# Altium schematic sheet stspin32g4.SchDoc (part 1 of 3)
size A3; SheetNumber: 2; SheetTotal: 4
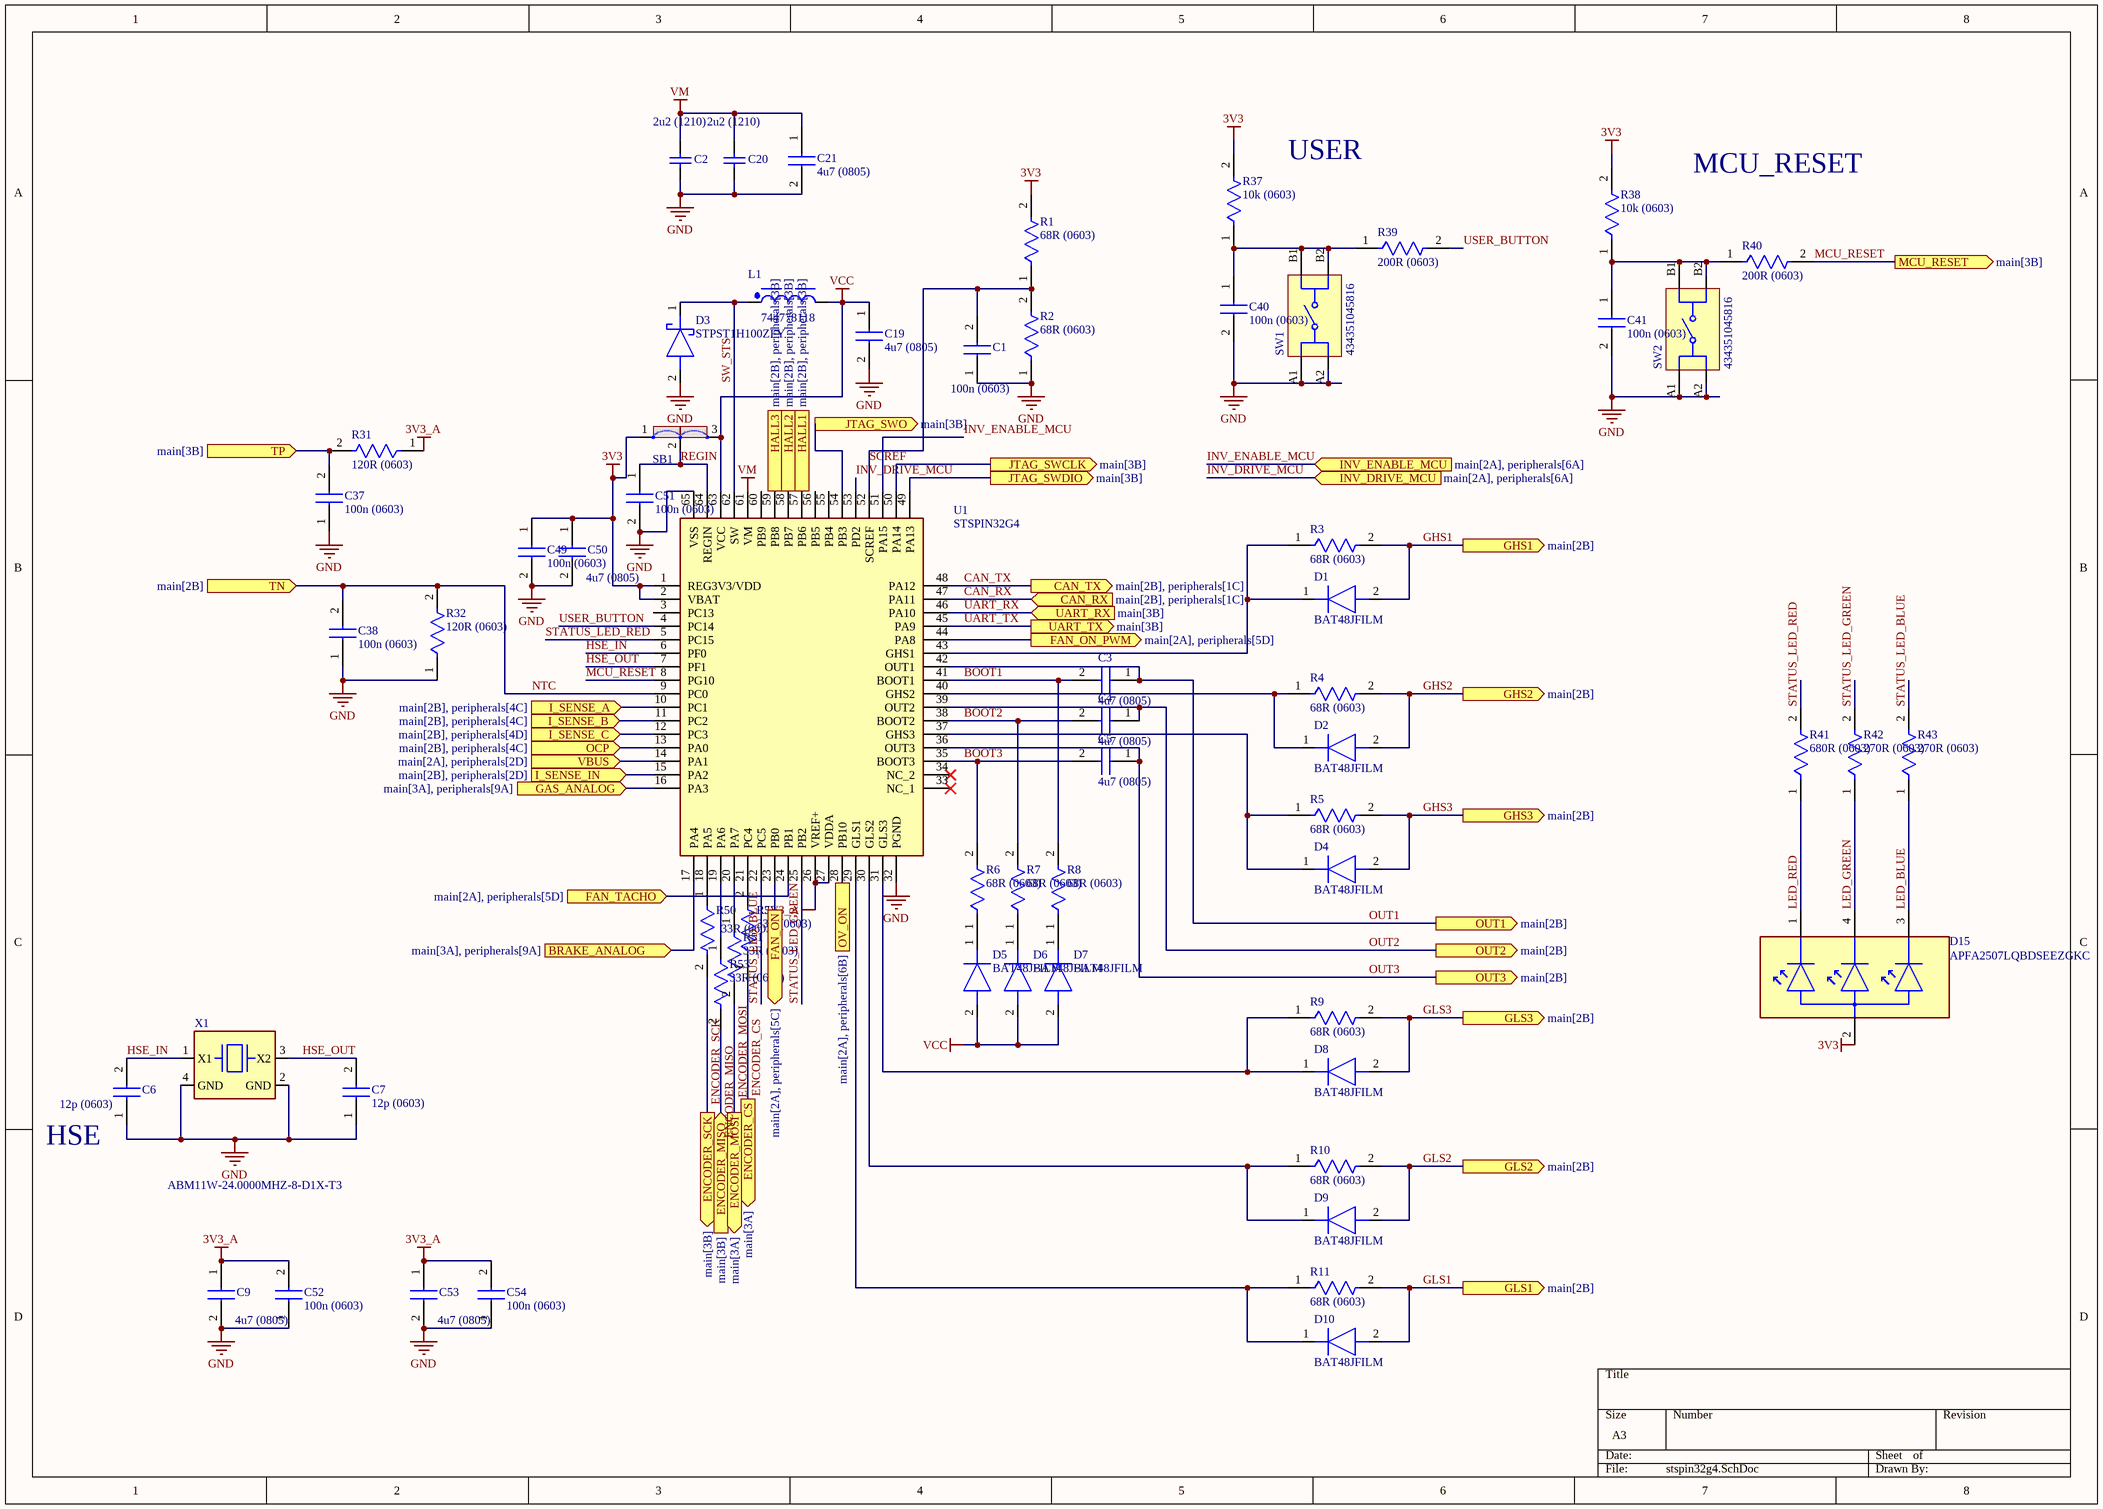
[diagram p0: stspin32g4.SchDoc]

## Parts
C1  100n (0603)  [C0603]
C2  2u2 (1210)  [WCAP-CSGP_1210_L3.2W2.5H2.5]
C3  4u7 (0805)  [C0805]
C4  4u7 (0805)  [C0805]
C5  4u7 (0805)  [C0805]
C6  12p (0603)  [C0603]
C7  12p (0603)  [C0603]
C9  4u7 (0805)  [C0805]
C19  4u7 (0805)  [C0805]
C20  2u2 (1210)  [WCAP-CSGP_1210_L3.2W2.5H2.5]
C21  4u7 (0805)  [C0805]
C37  100n (0603)  [C0603]
C38  100n (0603)  [C0603]
C40  100n (0603)  [C0603]
C41  100n (0603)  [C0603]
C49  100n (0603)  [C0603]
C50  4u7 (0805)  [C0805]
C51  100n (0603)  [C0603]
C52  100n (0603)  [C0603]
C53  4u7 (0805)  [C0805]
C54  100n (0603)  [C0603]
D1  BAT48JFILM  [SOD2513X117N]
D2  BAT48JFILM  [SOD2513X117N]
D3  STPST1H100ZFY  [SODFL3516X110N]
D4  BAT48JFILM  [SOD2513X117N]
D5  BAT48JFILM  [SOD2513X117N]
D6  BAT48JFILM  [SOD2513X117N]
D7  BAT48JFILM  [SOD2513X117N]
D8  BAT48JFILM  [SOD2513X117N]
D9  BAT48JFILM  [SOD2513X117N]
D10  BAT48JFILM  [SOD2513X117N]
D15  APFA2507LQBDSEEZGKC  [FP-APFA2507LQBDSEEZGKC-MFG]
L1  744778118  [WE-PD_7332]
R1  68R (0603)  [R0603]
R2  68R (0603)  [R0603]
R3  68R (0603)  [R0603]
R4  68R (0603)  [R0603]
R5  68R (0603)  [R0603]
R6  68R (0603)  [R0603]
R7  68R (0603)  [R0603]
R8  68R (0603)  [R0603]
R9  68R (0603)  [R0603]
R10  68R (0603)  [R0603]
R11  68R (0603)  [R0603]
R31  120R (0603)  [R0603]
R32  120R (0603)  [R0603]
R37  10k (0603)  [R0603]
R38  10k (0603)  [R0603]
R39  200R (0603)  [R0603]
R40  200R (0603)  [R0603]
R41  680R (0603)  [R0603]
R42  270R (0603)  [R0603]
R43  270R (0603)  [R0603]
R50  33R (0603)  [R0603]
R51  33R (0603)  [R0603]
R52  33R (0603)  [R0603]
R53  33R (0603)  [R0603]
SB1  triple_solder_jumper  [triple_solder_jumper]  (value not drawn)
SW1  434351045816  [434351045816]
SW2  434351045816  [434351045816]
U1  STSPIN32G4  [QFN50P900X900X100-65N-D]
X1  ABM11W-24.0000MHZ-8-D1X-T3  [XTAL_ABM11W-24.0000MHZ-8-D1X-T3]

## Ports
BRAKE_ANALOG (in, see main[3A], peripherals[9A]), CAN_RX (in, see main[2B], peripherals[1C]), CAN_TX (out, see main[2B], peripherals[1C]), ENCODER_CS (out, see main[3A]), ENCODER_MISO (in, see main[3B]), ENCODER_MOSI (out, see main[3A]), ENCODER_SCK (out, see main[3B]), FAN_ON (out, see main[2A], peripherals[5C]), FAN_ON_PWM (out, see main[2A], peripherals[5D]), FAN_TACHO (in, see main[2A], peripherals[5D]), GAS_ANALOG (in, see main[3A], peripherals[9A]), GHS1 (out, see main[2B]), GHS2 (out, see main[2B]), GHS3 (out, see main[2B]), GLS1 (out, see main[2B]), GLS2 (out, see main[2B]), GLS3 (out, see main[2B]), HALL1 (in, see main[2B], peripherals[3B]), HALL2 (in, see main[2B], peripherals[3B]), HALL3 (in, see main[2B], peripherals[3B]), I_SENSE_A (in, see main[2B], peripherals[4C]), I_SENSE_B (in, see main[2B], peripherals[4C]), I_SENSE_C (in, see main[2B], peripherals[4D]), I_SENSE_IN (in, see main[2B], peripherals[2D]), INV_DRIVE_MCU (in, see main[2A], peripherals[6A]), INV_ENABLE_MCU (in, see main[2A], peripherals[6A]), JTAG_SWCLK (out, see main[3B]), JTAG_SWDIO (out, see main[3B]), JTAG_SWO (out, see main[3B]), MCU_RESET (out, see main[3B]), OCP (in, see main[2B], peripherals[4C]), OUT1 (out, see main[2B]), OUT2 (out, see main[2B]), OUT3 (out, see main[2B]), OV_ON (out, see main[2A], peripherals[6B]), TN (in, see main[2B]), TP (in, see main[3B]), UART_RX (in, see main[3B]), UART_TX (out, see main[3B]), VBUS (in, see main[2A], peripherals[2D])

## Nets
3V3: C49.1 C50.1 D15.2(COMMON_ANODE) R1.2 R37.2 R38.2 SB1.1 U1.1(REG3V3/VDD) U1.2(VBAT)
3V3_A: C9.1 C52.2 C53.1 C54.2 R31.1 U1.26(VREF+) U1.27(VDDA)
GND: C1.1 C2.1 C6.1 C7.1 C9.2 C19.2 C20.1 C21.2 C37.1 C38.1 C40.2 C41.2 C49.2 C50.2 C51.2 C52.1 C53.2 C54.1 D3.2(A) R2.1 R32.1 SW1.A1 SW1.A2 SW2.A1 SW2.A2 U1.32(PGND) U1.65(VSS) X1.2(GND) X1.4(GND)
VCC: C19.1 D5.2(A) D6.2(A) D7.2(A) L1.2 SB1.3 U1.63(VCC)
VM: C2.2 C20.2 C21.1 U1.61(VM)
BOOT1: C3.2 R8.2 U1.41(BOOT1)
BOOT2: C4.2 R7.2 U1.38(BOOT2)
BOOT3: C5.2 R6.2 U1.35(BOOT3)
BRAKE_ANALOG: U1.17(PA4) ; port BRAKE_ANALOG
CAN_RX: U1.47(PA11) ; port CAN_RX
CAN_TX: U1.48(PA12) ; port CAN_TX
ENCODER_CS: R52.1 ; port ENCODER_CS
ENCODER_MISO: R53.2 ; port ENCODER_MISO
ENCODER_MOSI: R51.2 ; port ENCODER_MOSI
ENCODER_SCK: R50.2 ; port ENCODER_SCK
FAN_ON: U1.23(PB0) ; port FAN_ON
FAN_ON_PWM: U1.44(PA8) ; port FAN_ON_PWM
FAN_TACHO: U1.24(PB1) ; port FAN_TACHO
GAS_ANALOG: U1.16(PA3) ; port GAS_ANALOG
GHS1: D1.2(A) R3.2 ; port GHS1
GHS2: D2.2(A) R4.2 ; port GHS2
GHS3: D4.2(A) R5.2 ; port GHS3
GLS1: D10.2(A) R11.2 ; port GLS1
GLS2: D9.2(A) R10.2 ; port GLS2
GLS3: D8.2(A) R9.2 ; port GLS3
HALL1: U1.57(PB6) ; port HALL1
HALL2: U1.58(PB7) ; port HALL2
HALL3: U1.59(PB8) ; port HALL3
HSE_IN: C6.2 U1.6(PF0) X1.1(X1)
HSE_OUT: C7.2 U1.7(PF1) X1.3(X2)
I_SENSE_A: U1.10(PC1) ; port I_SENSE_A
I_SENSE_B: U1.11(PC2) ; port I_SENSE_B
I_SENSE_C: U1.12(PC3) ; port I_SENSE_C
I_SENSE_IN: U1.15(PA2) ; port I_SENSE_IN
INV_DRIVE_MCU: U1.53(PD2) ; port INV_DRIVE_MCU
INV_ENABLE_MCU: U1.51(PA15) ; port INV_ENABLE_MCU
JTAG_SWCLK: U1.50(PA14) ; port JTAG_SWCLK
JTAG_SWDIO: U1.49(PA13) ; port JTAG_SWDIO
JTAG_SWO: U1.54(PB3) ; port JTAG_SWO
LED_BLUE: D15.3(RED_C) R43.1
LED_GREEN: D15.4(GREEN_C) R42.1
LED_RED: D15.1(BLUE_C) R41.1
MCU_RESET: R40.2 U1.8(PG10) ; port MCU_RESET
NTC: C38.2 R32.2 U1.9(PC0) ; port TN
OCP: U1.13(PA0) ; port OCP
OUT1: C3.1 U1.42(OUT1) ; port OUT1
OUT2: C4.1 U1.39(OUT2) ; port OUT2
OUT3: C5.1 U1.36(OUT3) ; port OUT3
OV_ON: U1.28(PB10) ; port OV_ON
REGIN: C51.1 SB1.2 U1.64(REGIN)
SCREF: C1.2 R1.1 R2.2 U1.52(SCREF)
STATUS_LED_BLUE: R43.2 U1.22(PC5)
STATUS_LED_GREEN: R42.2 U1.25(PB2)
STATUS_LED_RED: R41.2 U1.5(PC15)
SW_STS: D3.1(K) L1.1 U1.62(SW)
TP: C37.2 R31.2 ; port TP
UART_RX: U1.46(PA10) ; port UART_RX
UART_TX: U1.45(PA9) ; port UART_TX
USER_BUTTON: R39.2 U1.4(PC14)
VBUS: U1.14(PA1) ; port VBUS
NetC40_1: C40.1 R37.1 R39.1 SW1.B1 SW1.B2
NetC41_1: C41.1 R38.1 R40.1 SW2.B1 SW2.B2
NetD1_1: D1.1(K) R3.1 U1.43(GHS1)
NetD2_1: D2.1(K) R4.1 U1.40(GHS2)
NetD4_1: D4.1(K) R5.1 U1.37(GHS3)
NetD5_1: D5.1(K) R6.1
NetD6_1: D6.1(K) R7.1
NetD7_1: D7.1(K) R8.1
NetD8_1: D8.1(K) R9.1 U1.31(GLS3)
NetD9_1: D9.1(K) R10.1 U1.30(GLS2)
NetD10_1: D10.1(K) R11.1 U1.29(GLS1)
NetR50_1: R50.1 U1.18(PA5)
NetR51_1: R51.1 U1.20(PA7)
NetR52_2: R52.2 U1.21(PC4)
NetR53_1: R53.1 U1.19(PA6)

Not connected (* = marked no-connect by the designer): U1 3(PC13) 33(NC_1)* 34(NC_2)* 55(PB4) 56(PB5) 60(PB9)

## Notes on the sheet
- USER
- MCU_RESET
- (near C6) HSE
## Library data of the parts
C1 C37 C38 C40 C41 C49 C51 = GCM188R71E104JA57D: CAP CER 0.1UF 25V X7R 0603 / 0.1 μF ±5% 25V Ceramic Capacitor X7R 0603 (1608 Metric); Manufacturer_Name: Murata Electronics; Manufacturer: Murata; Manufacturer Lifecycle Status: NRND; Value: 100nF; Datasheet Link: https://search.murata.co.jp/Ceramy/image/img/A01X/G101/ENG/GCM188R71E104JA57-01A.pdf; Height: 0.9mm; Manufacturer_Part_Number: GCM188R71E104JA57D; Mouser Part Number: 81-GCM188R71E104JAD; Mouser Price/Stock: https://www.mouser.co.uk/ProductDetail/Murata-Electronics/GCM188R71E104JA57D?qs=ui%252B2d9lVEI5lLkZDVYlCng%3D%3D; Arrow Part Number: GCM188R71E104JA57D; Arrow Price/Stock: https://www.arrow.com/en/products/gcm188r71e104ja57d/murata-manufacturing; Supplier: DigiKey; Supplier Part Number: 490-GCM188R71E104JA57DCT-ND; Manufacturer Part Number: GCM188R71E104JA57D; RoHS: Compliant; Category: Ceramic Capacitors; Stock: 2875; Pricing: 1=0,33, 10=0,196, 50=0,1434, 100=0,1272, 500=0,09986, 1000=0,09143 (USD); Case/Package: 0603; Country of Origin: Philippines; Dielectric Material: Ceramic; Export Control Classification Number (ECCN) Code: EAR99; Harmonized Tariff Schedule (HTS) Code: 8532.24.00.20; Introduction Date: 2013-11-20; Length: 1.6mm; Lifecycle Status: NRND; Max Operating Temperature: 125°C; Min Operating Temperature: -55°C; Mounting Technology: Surface Mount; Number of Terminals: 2; Ratings: AEC-Q200; REACH SVHC: Yes; Schedule B: 8532240020, 8532240020|8532240020|8532240020|8532240020|8532240020; Thickness: 800µm; Voltage Rating (DC): 25V; Width: 800µm; ComponentLink1URL: https://datasheet.octopart.com:443/GCM188R71E104JA57D-Murata-datasheet-141267551.pdf?src-supplier=Geoflip; ComponentLink1Description: https://datasheet.octopart.com:443/GCM188R71E104JA57D-Murata-datasheet-141267551.pdf?src-supplier=Geoflip; ComponentLink2URL: https://datasheet.octopart.com:443/GCM188R71E104JA57D-Murata-datasheet-140658663.pdf?src-supplier=Ciiva; ComponentLink2Description: https://datasheet.octopart.com:443/GCM188R71E104JA57D-Murata-datasheet-140658663.pdf?src-supplier=Ciiva; ComponentLink3URL: https://datasheet.octopart.com:443/GCM188R71E104JA57D-Murata-datasheet-138718229.pdf?src-supplier=Ciiva; ComponentLink3Description: https://datasheet.octopart.com:443/GCM188R71E104JA57D-Murata-datasheet-138718229.pdf?src-supplier=Ciiva; ComponentLink4URL: http://sigma.octopart.com:80/reach_statement/Murata-company-16.pdf?src-supplier=Compliance+Statements; ComponentLink4Description: http://sigma.octopart.com:80/reach_statement/Murata-company-16.pdf?src-supplier=Compliance+Statements
C2 C20 = CMP-03913-104794504-2: Cap, 2.2Uf, 100V, Mlcc, 1210 Rohs Compliant: Yes 885012209071; Insulation Resistance: 50MΩ; Length: 3.2mm; Min Operating Temperature: -55°C; Voltage Rating: 100V; Width: 2.5mm; Max Operating Temperature: 125°C; Height: 2.5mm; RoHS: Compliant; Parameter 1: *
C3-C5 C9 C19 C21 C50 C53 = GRM21BZ71E475KE15L: 25V 4.7uF X7R ±10% 0805 Multilayer Ceramic Capacitors MLCC - SMD/SMT ROHS; Manufacturer_Name: Murata Electronics; Manufacturer: Murata; Manufacturer Lifecycle Status: IN PRODUCTION; Value: 4.7µF; Datasheet Link: https://search.murata.co.jp/Ceramy/image/img/A01X/G101/ENG/GRM21BZ71E475KE15-01A.pdf; Height: 1.45mm; Manufacturer_Part_Number: GRM21BZ71E475KE15L; Mouser Part Number: 81-GRM21BZ71E475KE5L; Mouser Price/Stock: https://www.mouser.co.uk/ProductDetail/Murata-Electronics/GRM21BZ71E475KE15L?qs=Ey7%2FXF42M3feXnDNgc%252BFlQ%3D%3D; Arrow Part Number: GRM21BZ71E475KE15L; Arrow Price/Stock: https://www.arrow.com/en/products/grm21bz71e475ke15l/murata-manufacturing?utm_currency=USD&region=nac; Supplier: RS; Supplier Part Number: 2478136; Manufacturer Part Number: GRM21BZ71E475KE15L; RoHS: Compliant; Category: Ceramic Capacitors; Stock: 4700; Case/Package: 0805; Dielectric Material: Ceramic; Export Control Classification Number (ECCN) Code: EAR99; Harmonized Tariff Schedule (HTS) Code: 8532.24.00.20; Introduction Date: 2017-02-22; Length: 2mm; Lifecycle Status: Production; Material: Ceramic; Max Operating Temperature: 125°C; Min Operating Temperature: -55°C; Mounting Technology: Surface Mount; Number of Terminals: 2; REACH SVHC: Yes; Thickness: 1.25mm; Tolerance: 10%; Voltage Rating: 25V; Voltage Rating (DC): 25V; Width: 1.25mm; ComponentLink1URL: https://datasheet.octopart.com:443/GRM21BZ71E475KE15L-Murata-datasheet-155345087.pdf?src-supplier=Newark; ComponentLink1Description: https://datasheet.octopart.com:443/GRM21BZ71E475KE15L-Murata-datasheet-155345087.pdf?src-supplier=Newark; ComponentLink2URL: https://datasheet.octopart.com:443/GRM21BZ71E475KE15L-Murata-datasheet-141278877.pdf?src-supplier=Geoflip; ComponentLink2Description: https://datasheet.octopart.com:443/GRM21BZ71E475KE15L-Murata-datasheet-141278877.pdf?src-supplier=Geoflip; ComponentLink3URL: https://datasheet.octopart.com:443/GRM21BZ71E475KE15L-Murata-datasheet-165579666.pdf?src-supplier=TME; ComponentLink3Description: https://datasheet.octopart.com:443/GRM21BZ71E475KE15L-Murata-datasheet-165579666.pdf?src-supplier=TME; ComponentLink4URL: https://datasheet.octopart.com:443/GRM21BZ71E475KE15L-Murata-datasheet-140707839.pdf?src-supplier=Ciiva; ComponentLink4Description: https://datasheet.octopart.com:443/GRM21BZ71E475KE15L-Murata-datasheet-140707839.pdf?src-supplier=Ciiva; ComponentLink5URL: https://datasheet.octopart.com:443/GRM21BZ71E475KE15L-Murata-datasheet-138745135.pdf?src-supplier=Ciiva; ComponentLink5Description: https://datasheet.octopart.com:443/GRM21BZ71E475KE15L-Murata-datasheet-138745135.pdf?src-supplier=Ciiva; ComponentLink6URL: http://sigma.octopart.com:80/reach_statement/Murata-company-16.pdf?src-supplier=Compliance+Statements; ComponentLink6Description: http://sigma.octopart.com:80/reach_statement/Murata-company-16.pdf?src-supplier=Compliance+Statements
C6 C7 = CC0603FRNPO8BN120: Ceramic Capacitor, YES, Ceramic, 25V, 1% +Tol, 1% -Tol, C0G, 30ppm/Cel TC, 0.000012uF, Surface Mount, 0603; Manufacturer_Name: Murata Electronics; Manufacturer_Part_Number: GCM188R71E104JA57D; Manufacturer: Murata; Manufacturer Lifecycle Status: NRND; Value: 100nF; Datasheet Link: https://search.murata.co.jp/Ceramy/image/img/A01X/G101/ENG/GCM188R71E104JA57-01A.pdf; Height: 0.9mm; Mouser Part Number: 81-GCM188R71E104JAD; Mouser Price/Stock: https://www.mouser.co.uk/ProductDetail/Murata-Electronics/GCM188R71E104JA57D?qs=ui%252B2d9lVEI5lLkZDVYlCng%3D%3D; Arrow Part Number: GCM188R71E104JA57D; Arrow Price/Stock: https://www.arrow.com/en/products/gcm188r71e104ja57d/murata-manufacturing; Supplier: DigiKey; Supplier Part Number: 490-GCM188R71E104JA57DCT-ND; Manufacturer Part Number: GCM188R71E104JA57D; RoHS: Compliant; Category: Ceramic Capacitors; Stock: 2875; Pricing: 1=0,33, 10=0,196, 50=0,1434, 100=0,1272, 500=0,09986, 1000=0,09143 (USD); Case/Package: 0603; Country of Origin: Philippines; Dielectric Material: Ceramic; Export Control Classification Number (ECCN) Code: EAR99; Harmonized Tariff Schedule (HTS) Code: 8532.24.00.20; Introduction Date: 2013-11-20; Length: 1.6mm; Lifecycle Status: NRND; Max Operating Temperature: 125°C; Min Operating Temperature: -55°C; Mounting Technology: Surface Mount; Number of Terminals: 2; Ratings: AEC-Q200; REACH SVHC: Yes; Schedule B: 8532240020, 8532240020|8532240020|8532240020|8532240020|8532240020; Thickness: 800µm; Voltage Rating (DC): 25V; Width: 800µm; ComponentLink1URL: https://datasheet.octopart.com:443/GCM188R71E104JA57D-Murata-datasheet-141267551.pdf?src-supplier=Geoflip; ComponentLink1Description: https://datasheet.octopart.com:443/GCM188R71E104JA57D-Murata-datasheet-141267551.pdf?src-supplier=Geoflip; ComponentLink2URL: https://datasheet.octopart.com:443/GCM188R71E104JA57D-Murata-datasheet-140658663.pdf?src-supplier=Ciiva; ComponentLink2Description: https://datasheet.octopart.com:443/GCM188R71E104JA57D-Murata-datasheet-140658663.pdf?src-supplier=Ciiva; ComponentLink3URL: https://datasheet.octopart.com:443/GCM188R71E104JA57D-Murata-datasheet-138718229.pdf?src-supplier=Ciiva; ComponentLink3Description: https://datasheet.octopart.com:443/GCM188R71E104JA57D-Murata-datasheet-138718229.pdf?src-supplier=Ciiva; ComponentLink4URL: http://sigma.octopart.com:80/reach_statement/Murata-company-16.pdf?src-supplier=Compliance+Statements; ComponentLink4Description: http://sigma.octopart.com:80/reach_statement/Murata-company-16.pdf?src-supplier=Compliance+Statements; China RoHS: Compliant; Dielectric: C0G; Tolerance: 1%; ComponentLink5URL: https://datasheet.octopart.com:443/CC0603FRNPO8BN120-Yageo-datasheet-182140217.pdf?src-supplier=IHS; ComponentLink5Description: https://datasheet.octopart.com:443/CC0603FRNPO8BN120-Yageo-datasheet-182140217.pdf?src-supplier=IHS; ComponentLink6URL: http://sigma.octopart.com:80/conflict_mineral_statement/Yageo-company-3.pdf?src-supplier=Compliance+Statements; ComponentLink6Description: http://sigma.octopart.com:80/conflict_mineral_statement/Yageo-company-3.pdf?src-supplier=Compliance+Statements; ComponentLink7URL: http://sigma.octopart.com:80/rohs_statement/Yageo-company-2.pdf?src-supplier=Compliance+Statements; ComponentLink7Description: http://sigma.octopart.com:80/rohs_statement/Yageo-company-2.pdf?src-supplier=Compliance+Statements
C52 C54 = GCM188R71E105KA64D: 25V 1uF X7R ±10% 0603 Multilayer Ceramic Capacitors MLCC - SMD/SMT ROHS; Manufacturer_Name: Murata Electronics; Manufacturer_Part_Number: GCM188R71E104JA57D; Manufacturer: Murata; Manufacturer Lifecycle Status: NRND; Value: 100nF; Datasheet Link: https://search.murata.co.jp/Ceramy/image/img/A01X/G101/ENG/GCM188R71E104JA57-01A.pdf; Height: 0.9mm; Mouser Part Number: 81-GCM188R71E104JAD; Mouser Price/Stock: https://www.mouser.co.uk/ProductDetail/Murata-Electronics/GCM188R71E104JA57D?qs=ui%252B2d9lVEI5lLkZDVYlCng%3D%3D; Arrow Part Number: GCM188R71E104JA57D; Arrow Price/Stock: https://www.arrow.com/en/products/gcm188r71e104ja57d/murata-manufacturing; Supplier: DigiKey; Supplier Part Number: 490-GCM188R71E104JA57DCT-ND; Manufacturer Part Number: GCM188R71E104JA57D; RoHS: Compliant; Category: Ceramic Capacitors; Stock: 2875; Pricing: 1=0,33, 10=0,196, 50=0,1434, 100=0,1272, 500=0,09986, 1000=0,09143 (USD); Case/Package: 0603; Country of Origin: Philippines; Dielectric Material: Ceramic; Export Control Classification Number (ECCN) Code: EAR99; Harmonized Tariff Schedule (HTS) Code: 8532.24.00.20; Introduction Date: 2013-11-20; Length: 1.6mm; Lifecycle Status: NRND; Max Operating Temperature: 125°C; Min Operating Temperature: -55°C; Mounting Technology: Surface Mount; Number of Terminals: 2; Ratings: AEC-Q200; REACH SVHC: Yes; Schedule B: 8532240020, 8532240020|8532240020|8532240020|8532240020|8532240020; Thickness: 800µm; Voltage Rating (DC): 25V; Width: 800µm; ComponentLink1URL: https://datasheet.octopart.com:443/GCM188R71E104JA57D-Murata-datasheet-141267551.pdf?src-supplier=Geoflip; ComponentLink1Description: https://datasheet.octopart.com:443/GCM188R71E104JA57D-Murata-datasheet-141267551.pdf?src-supplier=Geoflip; ComponentLink2URL: https://datasheet.octopart.com:443/GCM188R71E104JA57D-Murata-datasheet-140658663.pdf?src-supplier=Ciiva; ComponentLink2Description: https://datasheet.octopart.com:443/GCM188R71E104JA57D-Murata-datasheet-140658663.pdf?src-supplier=Ciiva; ComponentLink3URL: https://datasheet.octopart.com:443/GCM188R71E104JA57D-Murata-datasheet-138718229.pdf?src-supplier=Ciiva; ComponentLink3Description: https://datasheet.octopart.com:443/GCM188R71E104JA57D-Murata-datasheet-138718229.pdf?src-supplier=Ciiva; ComponentLink4URL: http://sigma.octopart.com:80/reach_statement/Murata-company-16.pdf?src-supplier=Compliance+Statements; ComponentLink4Description: http://sigma.octopart.com:80/reach_statement/Murata-company-16.pdf?src-supplier=Compliance+Statements; Case Code (Imperial): 0603; Case Code (Metric): 1608; Depth: 800µm; Dielectric: X7R; Lead Free: Lead Free; Material: Ceramic; Packaging: Cut Tape; Radiation Hardening: No; Termination: SMD/SMT; Tolerance: 10%; Voltage: 25V; Voltage Rating: 25V; Weight: 6.293594mg; ComponentLink5URL: https://datasheet.octopart.com:443/GCM188R71E105KA64D-Murata-datasheet-39128443.pdf?src-supplier=Newark; ComponentLink5Description: https://datasheet.octopart.com:443/GCM188R71E105KA64D-Murata-datasheet-39128443.pdf?src-supplier=Newark; ComponentLink6URL: https://datasheet.octopart.com:443/GCM188R71E105KA64D-Murata-datasheet-62316951.pdf?src-supplier=element14+APAC; ComponentLink6Description: https://datasheet.octopart.com:443/GCM188R71E105KA64D-Murata-datasheet-62316951.pdf?src-supplier=element14+APAC; ComponentLink7URL: https://datasheet.octopart.com:443/GCM188R71E105KA64D-Murata-datasheet-141267554.pdf?src-supplier=Geoflip; ComponentLink7Description: https://datasheet.octopart.com:443/GCM188R71E105KA64D-Murata-datasheet-141267554.pdf?src-supplier=Geoflip; ComponentLink8URL: https://datasheet.octopart.com:443/GCM188R71E105KA64D-Murata-datasheet-140658666.pdf?src-supplier=Ciiva; ComponentLink8Description: https://datasheet.octopart.com:443/GCM188R71E105KA64D-Murata-datasheet-140658666.pdf?src-supplier=Ciiva; ComponentLink9URL: https://datasheet.octopart.com:443/GCM188R71E105KA64D-Murata-datasheet-138718232.pdf?src-supplier=Ciiva; ComponentLink9Description: https://datasheet.octopart.com:443/GCM188R71E105KA64D-Murata-datasheet-138718232.pdf?src-supplier=Ciiva; ComponentLink10URL: https://datasheet.octopart.com:443/GCM188R71E105KA64D-Murata-datasheet-81455541.pdf?src-supplier=TME; ComponentLink10Description: https://datasheet.octopart.com:443/GCM188R71E105KA64D-Murata-datasheet-81455541.pdf?src-supplier=TME; ComponentLink11URL: https://datasheet.octopart.com/GCM188R71E105KA64D-Murata-datasheet-14404430.pdf; ComponentLink11Description: https://datasheet.octopart.com/GCM188R71E105KA64D-Murata-datasheet-14404430.pdf; ComponentLink12URL: https://datasheet.octopart.com:443/GCM188R71E105KA64D-Murata-datasheet-14393380.pdf?src-supplier=Future+Electronics; ComponentLink12Description: https://datasheet.octopart.com:443/GCM188R71E105KA64D-Murata-datasheet-14393380.pdf?src-supplier=Future+Electronics; ComponentLink13URL: https://datasheet.octopart.com:443/GCM188R71E105KA64D-Murata-datasheet-44103482.pdf?src-supplier=Future+Electronics; ComponentLink13Description: https://datasheet.octopart.com:443/GCM188R71E105KA64D-Murata-datasheet-44103482.pdf?src-supplier=Future+Electronics
D1 D2 D4-D10 = BAT48JFILM: Diode; Manufacturer_Name: STMicroelectronics; Datasheet Link: https://www.st.com/resource/en/datasheet/bat48.pdf; Height: 1.17mm; Manufacturer_Part_Number: BAT48JFILM; Mouser Part Number: 511-BAT48JFILM; Mouser Price/Stock: https://www.mouser.co.uk/ProductDetail/STMicroelectronics/BAT48JFILM?qs=jZi1jxfVU96ub22u%252BA2DtA%3D%3D; Arrow Part Number: BAT48JFILM; Arrow Price/Stock: https://www.arrow.com/en/products/bat48jfilm/stmicroelectronics.html?utm_currency=USD&region=nac
D3 = STPST1H100ZFY: Schottky Diode; Manufacturer_Name: STMicroelectronics; Datasheet Link: https://www.st.com/resource/en/datasheet/stpst1h100-y.pdf; Height: 1.1mm; Manufacturer_Part_Number: STPST1H100ZFY; Mouser Part Number: 511-STPST1H100ZFY; Mouser Price/Stock: https://www.mouser.co.uk/ProductDetail/STMicroelectronics/STPST1H100ZFY?qs=Jm2GQyTW%2FbiCa1fy2WZ27w%3D%3D
D15 = CMP-44529-000068-1: LED RGB CLEAR 4SMD R/A; Dominant Wavelength: 465nm; Test Current: 2mA; Forward Voltage: 2.7V; Lens Color: Colorless; Viewing Angle: 140°; Color: Blue; Luminous Intensity: 60mcd; Height: 0.85mm; RoHS Compliant: Yes; Case/Package: SMD/SMT; Mount: Surface Mount; Lens Transparency: Clear; Packaging: Tape and Reel; Width: 1mm; Length: 2.5mm
L1 = CMP-0227-00121-3: Power Choke Shielded Wirewound 18uH 20% 1KHz Ferrite 1.41A 0.14Ohm DCR T/R Automotive AEC-Q200; Resistance: 14Ω; Self Resonant Frequency: 19.6MHz; DC Resistance (DCR): 114mΩ; Inductance: 18µH; Max Operating Temperature: 125°C; Test Frequency: 1kHz; Tolerance: 20%; Ambient Temperature Range High: 85°C; Number of Pins: 2; Min Operating Temperature: -40°C; RoHS: Compliant; Width: 7.3mm; Length: 7.3mm; Shielding: Shielded; Height: 3.2mm; Max DC Current: 1.41A; Current Rating: 1.41A; Packaging: Tape & Reel; Termination: SMD/SMT; Ambient Temperature Range Low: -40°C; Case/Package: SMD/SMT
R1-R11 R39 R40 = RK73H1JTTD68R0F: Res Thick Film 0603 68 Ohm 1% 0.125W(1/8W) ±100ppm/C Pad SMD Automotive T/R; Manufacturer_Name: Yageo Group; Manufacturer_Part_Number: SR0603FR-7T10KL; Power Rating: 250mW; Value: 10kΩ; Temperature Coefficient: 100ppm/°C; Voltage Rating: 75V; Working Voltage: 150V; Voltage Rating (DC): 50V; Datasheet Link: https://mouser.componentsearchengine.com/Datasheets/1/SR0603FR-7T10KL.pdf; Height: 0.55mm; Mouser Part Number: 603-SR0603FR-7T10KL; Mouser Price/Stock: https://www.mouser.co.uk/ProductDetail/YAGEO/SR0603FR-7T10KL?qs=pfd5qewlna6IurLw3u3uRA%3D%3D; Arrow Part Number: SR0603FR-7T10KL; Arrow Price/Stock: https://www.arrow.com/en/products/sr0603fr-7t10kl/yageo; Supplier: DigiKey; Supplier Part Number: YAG5823CT-ND; Manufacturer: Yageo Group; Manufacturer Part Number: SR0603FR-7T10KL; RoHS: Compliant; Category: Chip SMD Resistors; Pricing: 1=0,67, 10=0,399, 25=0,3376, 50=0,3022, 100=0,2744, 250=0,24612, 500=0,22976, 1000=0,21675 (USD); Case/Package: 0603; China RoHS: Non-Compliant; Composition: Thick Film; Country of Origin: Mainland China, Taiwan; Export Control Classification Number (ECCN) Code: EAR99; Harmonized Tariff Schedule (HTS) Code: 8533.21.00.30; Introduction Date: 2017-10-02; Length: 1.6mm; Lifecycle Status: Production; Max Operating Temperature: 155°C; Min Operating Temperature: -55°C; Mounting Technology: Surface Mount; Number of Terminals: 2; Packaging: Tape & Reel; Ratings: AEC-Q200; REACH SVHC: Yes; Tolerance: 1%; Width: 800µm; ComponentLink1URL: https://datasheet.octopart.com:443/SR0603FR-7T10KL-Yageo-datasheet-176402240.pdf?src-supplier=Farnell; ComponentLink1Description: https://datasheet.octopart.com:443/SR0603FR-7T10KL-Yageo-datasheet-176402240.pdf?src-supplier=Farnell; ComponentLink2URL: https://datasheet.octopart.com:443/SR0603FR-7T10KL-Yageo-datasheet-119732217.pdf?src-supplier=Upverter; ComponentLink2Description: https://datasheet.octopart.com:443/SR0603FR-7T10KL-Yageo-datasheet-119732217.pdf?src-supplier=Upverter; ComponentLink3URL: https://datasheet.octopart.com:443/SR0603FR-7T10KL-Yageo-Group-datasheet-184785656.pdf?src-supplier=Future+Electronics; ComponentLink3Description: https://datasheet.octopart.com:443/SR0603FR-7T10KL-Yageo-Group-datasheet-184785656.pdf?src-supplier=Future+Electronics; ComponentLink4URL: https://datasheet.octopart.com:443/SR0603FR-7T10KL-Yageo-datasheet-155675517.pdf?src-supplier=Future+Electronics; ComponentLink4Description: https://datasheet.octopart.com:443/SR0603FR-7T10KL-Yageo-datasheet-155675517.pdf?src-supplier=Future+Electronics; ComponentLink5URL: https://datasheet.octopart.com:443/SR0603FR-7T10KL-Yageo-datasheet-137701088.pdf?src-supplier=Future+Electronics; ComponentLink5Description: https://datasheet.octopart.com:443/SR0603FR-7T10KL-Yageo-datasheet-137701088.pdf?src-supplier=Future+Electronics; ComponentLink6URL: https://datasheet.octopart.com/SR0603FR-7T10KL-Yageo-datasheet-11047080.pdf; ComponentLink6Description: https://datasheet.octopart.com/SR0603FR-7T10KL-Yageo-datasheet-11047080.pdf; ComponentLink7URL: http://sigma.octopart.com:80/conflict_mineral_statement/Yageo-company-3.pdf?src-supplier=Compliance+Statements; ComponentLink7Description: http://sigma.octopart.com:80/conflict_mineral_statement/Yageo-company-3.pdf?src-supplier=Compliance+Statements; ComponentLink8URL: http://sigma.octopart.com:80/rohs_statement/Yageo-company-2.pdf?src-supplier=Compliance+Statements; ComponentLink8Description: http://sigma.octopart.com:80/rohs_statement/Yageo-company-2.pdf?src-supplier=Compliance+Statements; Stock: 5000; ComponentLink9URL: https://datasheet.octopart.com:443/SR0603FR-7T4R7L-Yageo-datasheet-176402240.pdf?src-supplier=Farnell; ComponentLink9Description: https://datasheet.octopart.com:443/SR0603FR-7T4R7L-Yageo-datasheet-176402240.pdf?src-supplier=Farnell; ComponentLink10URL: https://datasheet.octopart.com:443/SR0603FR-7T4R7L-Yageo-datasheet-119732217.pdf?src-supplier=Upverter; ComponentLink10Description: https://datasheet.octopart.com:443/SR0603FR-7T4R7L-Yageo-datasheet-119732217.pdf?src-supplier=Upverter; ComponentLink11URL: https://datasheet.octopart.com:443/SR0603FR-7T4R7L-Yageo-Group-datasheet-184785656.pdf?src-supplier=Future+Electronics; ComponentLink11Description: https://datasheet.octopart.com:443/SR0603FR-7T4R7L-Yageo-Group-datasheet-184785656.pdf?src-supplier=Future+Electronics; ComponentLink12URL: https://datasheet.octopart.com:443/SR0603FR-7T4R7L-Yageo-datasheet-155675517.pdf?src-supplier=Future+Electronics; ComponentLink12Description: https://datasheet.octopart.com:443/SR0603FR-7T4R7L-Yageo-datasheet-155675517.pdf?src-supplier=Future+Electronics; ComponentLink13URL: https://datasheet.octopart.com:443/SR0603FR-7T4R7L-Yageo-datasheet-137701088.pdf?src-supplier=Future+Electronics; ComponentLink13Description: https://datasheet.octopart.com:443/SR0603FR-7T4R7L-Yageo-datasheet-137701088.pdf?src-supplier=Future+Electronics; ComponentLink14URL: https://datasheet.octopart.com/SR0603FR-7T4R7L-Yageo-datasheet-11047080.pdf; ComponentLink14Description: https://datasheet.octopart.com/SR0603FR-7T4R7L-Yageo-datasheet-11047080.pdf; Max Voltage Rating (DC): 150V; ComponentLink15URL: https://datasheet.octopart.com:443/SG73G1JTTD5102C-KOA-Speer-datasheet-181956059.pdf?src-supplier=IHS; ComponentLink15Description: https://datasheet.octopart.com:443/SG73G1JTTD5102C-KOA-Speer-datasheet-181956059.pdf?src-supplier=IHS; ComponentLink16URL: https://sigma.octopart.com:443/141350679/technical_drawing/KOA-Speer-SG73G1JTTD5102C.pdf?src-supplier=KOA+Speer+SCT; ComponentLink16Description: https://sigma.octopart.com:443/141350679/technical_drawing/KOA-Speer-SG73G1JTTD5102C.pdf?src-supplier=KOA+Speer+SCT; ComponentLink17URL: https://datasheet.octopart.com:443/SG73G1JTTD5102C-KOA-Speer-datasheet-141350755.pdf?src-supplier=KOA+Speer+SCT; ComponentLink17Description: https://datasheet.octopart.com:443/SG73G1JTTD5102C-KOA-Speer-datasheet-141350755.pdf?src-supplier=KOA+Speer+SCT; ComponentLink18URL: http://sigma.octopart.com:80/rohs_statement/KOA-Speer-company-17.pdf?src-supplier=Compliance+Statements; ComponentLink18Description: http://sigma.octopart.com:80/rohs_statement/KOA-Speer-company-17.pdf?src-supplier=Compliance+Statements; ComponentLink19URL: https://datasheet.octopart.com:443/ESR03EZPD5102-ROHM-datasheet-182147624.pdf?src-supplier=IHS; ComponentLink19Description: https://datasheet.octopart.com:443/ESR03EZPD5102-ROHM-datasheet-182147624.pdf?src-supplier=IHS; Case Code (Imperial): 0603; Case Code (Metric): 1608; Depth: 800µm; Lead Free: Lead Free; Military Standard: Not; Schedule B: 8533210045, 8533210045|8533210045, 8533210045|8533210045|8533210045, 8533210045|8533210045|8533210045|8533210045; Termination: SMD/SMT; ComponentLink20URL: https://datasheet.octopart.com:443/RK73H1JTTD68R0F-KOA-Speer-datasheet-181956035.pdf?src-supplier=IHS; ComponentLink20Description: https://datasheet.octopart.com:443/RK73H1JTTD68R0F-KOA-Speer-datasheet-181956035.pdf?src-supplier=IHS; ComponentLink21URL: https://datasheet.octopart.com:443/RK73H1JTTD68R0F-KOA-Speer-datasheet-11590619.pdf?src-supplier=Upverter; ComponentLink21Description: https://datasheet.octopart.com:443/RK73H1JTTD68R0F-KOA-Speer-datasheet-11590619.pdf?src-supplier=Upverter; ComponentLink22URL: https://datasheet.octopart.com:443/RK73H1JTTD68R0F-KOA-Speer-datasheet-149653815.pdf?src-supplier=Newark; ComponentLink22Description: https://datasheet.octopart.com:443/RK73H1JTTD68R0F-KOA-Speer-datasheet-149653815.pdf?src-supplier=Newark; ComponentLink23URL: https://datasheet.octopart.com:443/RK73H1JTTD68R0F-KOA-Speer-datasheet-10854116.pdf?src-supplier=element14+APAC; ComponentLink23Description: https://datasheet.octopart.com:443/RK73H1JTTD68R0F-KOA-Speer-datasheet-10854116.pdf?src-supplier=element14+APAC
R31 R32 = RK73H1JTTD1200F: Res Thick Film 0603 120 Ohm 1% 0.125W(1/8W) ±100ppm/C Pad SMD T/R Automotive AEC-Q200; Manufacturer_Name: Yageo Group; Manufacturer_Part_Number: SR0603FR-7T10KL; Power Rating: 250mW; Value: 10kΩ; Temperature Coefficient: 100ppm/°C; Voltage Rating: 75V; Working Voltage: 150V; Voltage Rating (DC): 50V; Max Power Dissipation: 125mW; Datasheet Link: https://mouser.componentsearchengine.com/Datasheets/1/SR0603FR-7T10KL.pdf; Height: 0.55mm; Mouser Part Number: 603-SR0603FR-7T10KL; Mouser Price/Stock: https://www.mouser.co.uk/ProductDetail/YAGEO/SR0603FR-7T10KL?qs=pfd5qewlna6IurLw3u3uRA%3D%3D; Arrow Part Number: SR0603FR-7T10KL; Arrow Price/Stock: https://www.arrow.com/en/products/sr0603fr-7t10kl/yageo; Supplier: DigiKey; Supplier Part Number: YAG5823CT-ND; Manufacturer: Yageo Group; Manufacturer Part Number: SR0603FR-7T10KL; RoHS: Compliant; Category: Chip SMD Resistors; Pricing: 1=0,67, 10=0,399, 25=0,3376, 50=0,3022, 100=0,2744, 250=0,24612, 500=0,22976, 1000=0,21675 (USD); Case/Package: 0603; China RoHS: Non-Compliant; Composition: Thick Film; Country of Origin: Mainland China, Taiwan; Export Control Classification Number (ECCN) Code: EAR99; Harmonized Tariff Schedule (HTS) Code: 8533.21.00.30; Introduction Date: 2017-10-02; Length: 1.6mm; Lifecycle Status: Production; Max Operating Temperature: 155°C; Min Operating Temperature: -55°C; Mounting Technology: Surface Mount; Number of Terminals: 2; Packaging: Tape & Reel; Ratings: AEC-Q200; REACH SVHC: Yes; Tolerance: 1%; Width: 800µm; ComponentLink1URL: https://datasheet.octopart.com:443/SR0603FR-7T10KL-Yageo-datasheet-176402240.pdf?src-supplier=Farnell; ComponentLink1Description: https://datasheet.octopart.com:443/SR0603FR-7T10KL-Yageo-datasheet-176402240.pdf?src-supplier=Farnell; ComponentLink2URL: https://datasheet.octopart.com:443/SR0603FR-7T10KL-Yageo-datasheet-119732217.pdf?src-supplier=Upverter; ComponentLink2Description: https://datasheet.octopart.com:443/SR0603FR-7T10KL-Yageo-datasheet-119732217.pdf?src-supplier=Upverter; ComponentLink3URL: https://datasheet.octopart.com:443/SR0603FR-7T10KL-Yageo-Group-datasheet-184785656.pdf?src-supplier=Future+Electronics; ComponentLink3Description: https://datasheet.octopart.com:443/SR0603FR-7T10KL-Yageo-Group-datasheet-184785656.pdf?src-supplier=Future+Electronics; ComponentLink4URL: https://datasheet.octopart.com:443/SR0603FR-7T10KL-Yageo-datasheet-155675517.pdf?src-supplier=Future+Electronics; ComponentLink4Description: https://datasheet.octopart.com:443/SR0603FR-7T10KL-Yageo-datasheet-155675517.pdf?src-supplier=Future+Electronics; ComponentLink5URL: https://datasheet.octopart.com:443/SR0603FR-7T10KL-Yageo-datasheet-137701088.pdf?src-supplier=Future+Electronics; ComponentLink5Description: https://datasheet.octopart.com:443/SR0603FR-7T10KL-Yageo-datasheet-137701088.pdf?src-supplier=Future+Electronics; ComponentLink6URL: https://datasheet.octopart.com/SR0603FR-7T10KL-Yageo-datasheet-11047080.pdf; ComponentLink6Description: https://datasheet.octopart.com/SR0603FR-7T10KL-Yageo-datasheet-11047080.pdf; ComponentLink7URL: http://sigma.octopart.com:80/conflict_mineral_statement/Yageo-company-3.pdf?src-supplier=Compliance+Statements; ComponentLink7Description: http://sigma.octopart.com:80/conflict_mineral_statement/Yageo-company-3.pdf?src-supplier=Compliance+Statements; ComponentLink8URL: http://sigma.octopart.com:80/rohs_statement/Yageo-company-2.pdf?src-supplier=Compliance+Statements; ComponentLink8Description: http://sigma.octopart.com:80/rohs_statement/Yageo-company-2.pdf?src-supplier=Compliance+Statements; Stock: 5000; ComponentLink9URL: https://datasheet.octopart.com:443/SR0603FR-7T4R7L-Yageo-datasheet-176402240.pdf?src-supplier=Farnell; ComponentLink9Description: https://datasheet.octopart.com:443/SR0603FR-7T4R7L-Yageo-datasheet-176402240.pdf?src-supplier=Farnell; ComponentLink10URL: https://datasheet.octopart.com:443/SR0603FR-7T4R7L-Yageo-datasheet-119732217.pdf?src-supplier=Upverter; ComponentLink10Description: https://datasheet.octopart.com:443/SR0603FR-7T4R7L-Yageo-datasheet-119732217.pdf?src-supplier=Upverter; ComponentLink11URL: https://datasheet.octopart.com:443/SR0603FR-7T4R7L-Yageo-Group-datasheet-184785656.pdf?src-supplier=Future+Electronics; ComponentLink11Description: https://datasheet.octopart.com:443/SR0603FR-7T4R7L-Yageo-Group-datasheet-184785656.pdf?src-supplier=Future+Electronics; ComponentLink12URL: https://datasheet.octopart.com:443/SR0603FR-7T4R7L-Yageo-datasheet-155675517.pdf?src-supplier=Future+Electronics; ComponentLink12Description: https://datasheet.octopart.com:443/SR0603FR-7T4R7L-Yageo-datasheet-155675517.pdf?src-supplier=Future+Electronics; ComponentLink13URL: https://datasheet.octopart.com:443/SR0603FR-7T4R7L-Yageo-datasheet-137701088.pdf?src-supplier=Future+Electronics; ComponentLink13Description: https://datasheet.octopart.com:443/SR0603FR-7T4R7L-Yageo-datasheet-137701088.pdf?src-supplier=Future+Electronics; ComponentLink14URL: https://datasheet.octopart.com/SR0603FR-7T4R7L-Yageo-datasheet-11047080.pdf; ComponentLink14Description: https://datasheet.octopart.com/SR0603FR-7T4R7L-Yageo-datasheet-11047080.pdf; Max Voltage Rating (DC): 150V; ComponentLink15URL: https://datasheet.octopart.com:443/SG73G1JTTD5102C-KOA-Speer-datasheet-181956059.pdf?src-supplier=IHS; ComponentLink15Description: https://datasheet.octopart.com:443/SG73G1JTTD5102C-KOA-Speer-datasheet-181956059.pdf?src-supplier=IHS; ComponentLink16URL: https://sigma.octopart.com:443/141350679/technical_drawing/KOA-Speer-SG73G1JTTD5102C.pdf?src-supplier=KOA+Speer+SCT; ComponentLink16Description: https://sigma.octopart.com:443/141350679/technical_drawing/KOA-Speer-SG73G1JTTD5102C.pdf?src-supplier=KOA+Speer+SCT; ComponentLink17URL: https://datasheet.octopart.com:443/SG73G1JTTD5102C-KOA-Speer-datasheet-141350755.pdf?src-supplier=KOA+Speer+SCT; ComponentLink17Description: https://datasheet.octopart.com:443/SG73G1JTTD5102C-KOA-Speer-datasheet-141350755.pdf?src-supplier=KOA+Speer+SCT; ComponentLink18URL: http://sigma.octopart.com:80/rohs_statement/KOA-Speer-company-17.pdf?src-supplier=Compliance+Statements; ComponentLink18Description: http://sigma.octopart.com:80/rohs_statement/KOA-Speer-company-17.pdf?src-supplier=Compliance+Statements; ComponentLink19URL: https://datasheet.octopart.com:443/ESR03EZPD5102-ROHM-datasheet-182147624.pdf?src-supplier=IHS; ComponentLink19Description: https://datasheet.octopart.com:443/ESR03EZPD5102-ROHM-datasheet-182147624.pdf?src-supplier=IHS; Case Code (Imperial): 0603; Case Code (Metric): 1608; Depth: 800µm; Lead Free: Lead Free; Military Standard: Not; Schedule B: 8533210045, 8533210045|8533210045, 8533210045|8533210045|8533210045, 8533210045|8533210045|8533210045|8533210045; Termination: SMD/SMT; ComponentLink20URL: https://datasheet.octopart.com:443/RK73H1JTTD68R0F-KOA-Speer-datasheet-181956035.pdf?src-supplier=IHS; ComponentLink20Description: https://datasheet.octopart.com:443/RK73H1JTTD68R0F-KOA-Speer-datasheet-181956035.pdf?src-supplier=IHS; ComponentLink21URL: https://datasheet.octopart.com:443/RK73H1JTTD68R0F-KOA-Speer-datasheet-11590619.pdf?src-supplier=Upverter; ComponentLink21Description: https://datasheet.octopart.com:443/RK73H1JTTD68R0F-KOA-Speer-datasheet-11590619.pdf?src-supplier=Upverter; ComponentLink22URL: https://datasheet.octopart.com:443/RK73H1JTTD68R0F-KOA-Speer-datasheet-149653815.pdf?src-supplier=Newark; ComponentLink22Description: https://datasheet.octopart.com:443/RK73H1JTTD68R0F-KOA-Speer-datasheet-149653815.pdf?src-supplier=Newark; ComponentLink23URL: https://datasheet.octopart.com:443/RK73H1JTTD68R0F-KOA-Speer-datasheet-10854116.pdf?src-supplier=element14+APAC; ComponentLink23Description: https://datasheet.octopart.com:443/RK73H1JTTD68R0F-KOA-Speer-datasheet-10854116.pdf?src-supplier=element14+APAC; Contact Plating: Tin; Features: Anti-Sulfur, Moisture Resistant; Number of Terminations: 2; Radiation Hardening: No; ComponentLink24URL: https://datasheet.octopart.com:443/RNCP0603FTD10K0-Stackpole-Electronics-datasheet-182148179.pdf?src-supplier=IHS; ComponentLink24Description: https://datasheet.octopart.com:443/RNCP0603FTD10K0-Stackpole-Electronics-datasheet-182148179.pdf?src-supplier=IHS; ComponentLink25URL: https://datasheet.octopart.com:443/RNCP0603FTD10K0-Stackpole-Electronics-datasheet-141193801.pdf?src-supplier=Upverter; ComponentLink25Description: https://datasheet.octopart.com:443/RNCP0603FTD10K0-Stackpole-Electronics-datasheet-141193801.pdf?src-supplier=Upverter; ComponentLink26URL: https://datasheet.octopart.com:443/RNCP0603FTD10K0-Stackpole-Electronics-datasheet-38896780.pdf?src-supplier=Upverter; ComponentLink26Description: https://datasheet.octopart.com:443/RNCP0603FTD10K0-Stackpole-Electronics-datasheet-38896780.pdf?src-supplier=Upverter; ComponentLink27URL: https://datasheet.octopart.com:443/RNCP0603FTD10K0-Stackpole-Electronics-datasheet-149178200.pdf?src-supplier=Upverter; ComponentLink27Description: https://datasheet.octopart.com:443/RNCP0603FTD10K0-Stackpole-Electronics-datasheet-149178200.pdf?src-supplier=Upverter; ComponentLink28URL: https://datasheet.octopart.com:443/RNCP0603FTD10K0-Stackpole-Electronics-datasheet-33021030.pdf?src-supplier=Future+Electronics; ComponentLink28Description: https://datasheet.octopart.com:443/RNCP0603FTD10K0-Stackpole-Electronics-datasheet-33021030.pdf?src-supplier=Future+Electronics; ComponentLink29URL: http://sigma.octopart.com:80/15942470/materials_sheet/Stackpole-Electronics-RNCP0603FTD10K0.pdf?src-supplier=Compliance+Statements; ComponentLink29Description: http://sigma.octopart.com:80/15942470/materials_sheet/Stackpole-Electronics-RNCP0603FTD10K0.pdf?src-supplier=Compliance+Statements; ComponentLink30URL: http://sigma.octopart.com:80/141158212/rohs_statement/Stackpole-Electronics-RNCP0603FTD10K0.pdf?src-supplier=Compliance+Statements; ComponentLink30Description: http://sigma.octopart.com:80/141158212/rohs_statement/Stackpole-Electronics-RNCP0603FTD10K0.pdf?src-supplier=Compliance+Statements; ComponentLink31URL: http://sigma.octopart.com:80/141158211/reach_statement/Stackpole-Electronics-RNCP0603FTD10K0.pdf?src-supplier=Compliance+Statements; ComponentLink31Description: http://sigma.octopart.com:80/141158211/reach_statement/Stackpole-Electronics-RNCP0603FTD10K0.pdf?src-supplier=Compliance+Statements; Pins: 2; ComponentLink32URL: https://datasheet.octopart.com:443/RK73H1JTTD1200F-KOA-Speer-datasheet-181956035.pdf?src-supplier=IHS; ComponentLink32Description: https://datasheet.octopart.com:443/RK73H1JTTD1200F-KOA-Speer-datasheet-181956035.pdf?src-supplier=IHS; ComponentLink33URL: https://datasheet.octopart.com:443/RK73H1JTTD1200F-KOA-Speer-datasheet-11590619.pdf?src-supplier=Upverter; ComponentLink33Description: https://datasheet.octopart.com:443/RK73H1JTTD1200F-KOA-Speer-datasheet-11590619.pdf?src-supplier=Upverter; ComponentLink34URL: https://datasheet.octopart.com:443/RK73H1JTTD1200F-KOA-Speer-datasheet-149653815.pdf?src-supplier=Farnell; ComponentLink34Description: https://datasheet.octopart.com:443/RK73H1JTTD1200F-KOA-Speer-datasheet-149653815.pdf?src-supplier=Farnell; ComponentLink35URL: https://datasheet.octopart.com:443/RK73H1JTTD1200F-KOA-Speer-datasheet-188906116.pdf?src-supplier=TME; ComponentLink35Description: https://datasheet.octopart.com:443/RK73H1JTTD1200F-KOA-Speer-datasheet-188906116.pdf?src-supplier=TME; ComponentLink36URL: https://datasheet.octopart.com/RK73H-%7C-Flat-Chip-Resistors-%28Precision-Grade%29-KOA-Speer-datasheet-family-85.pdf; ComponentLink36Description: https://datasheet.octopart.com/RK73H-%7C-Flat-Chip-Resistors-%28Precision-Grade%29-KOA-Speer-datasheet-family-85.pdf; ComponentLink37URL: https://datasheet.octopart.com:443/RK73H1JTTD1200F-KOA-Speer-datasheet-10854116.pdf?src-supplier=element14+APAC; ComponentLink37Description: https://datasheet.octopart.com:443/RK73H1JTTD1200F-KOA-Speer-datasheet-10854116.pdf?src-supplier=element14+APAC; ComponentLink38URL: http://sigma.octopart.com:80/rohs_certificate/RK73H-%7C-Flat-Chip-Resistors-%28Precision-Grade%29-KOA-Speer-family-91.pdf?src-supplier=Compliance+Statements; ComponentLink38Description: http://sigma.octopart.com:80/rohs_certificate/RK73H-%7C-Flat-Chip-Resistors-%28Precision-Grade%29-KOA-Speer-family-91.pdf?src-supplier=Compliance+Statements